# Altium schematic sheet 4.Communication Interface.SchDoc
size A4; Author: ZhangPan; Revision: 2.0; SheetNumber: 4; SheetTotal: 4; Size: A3; Contact: 0731-88731029
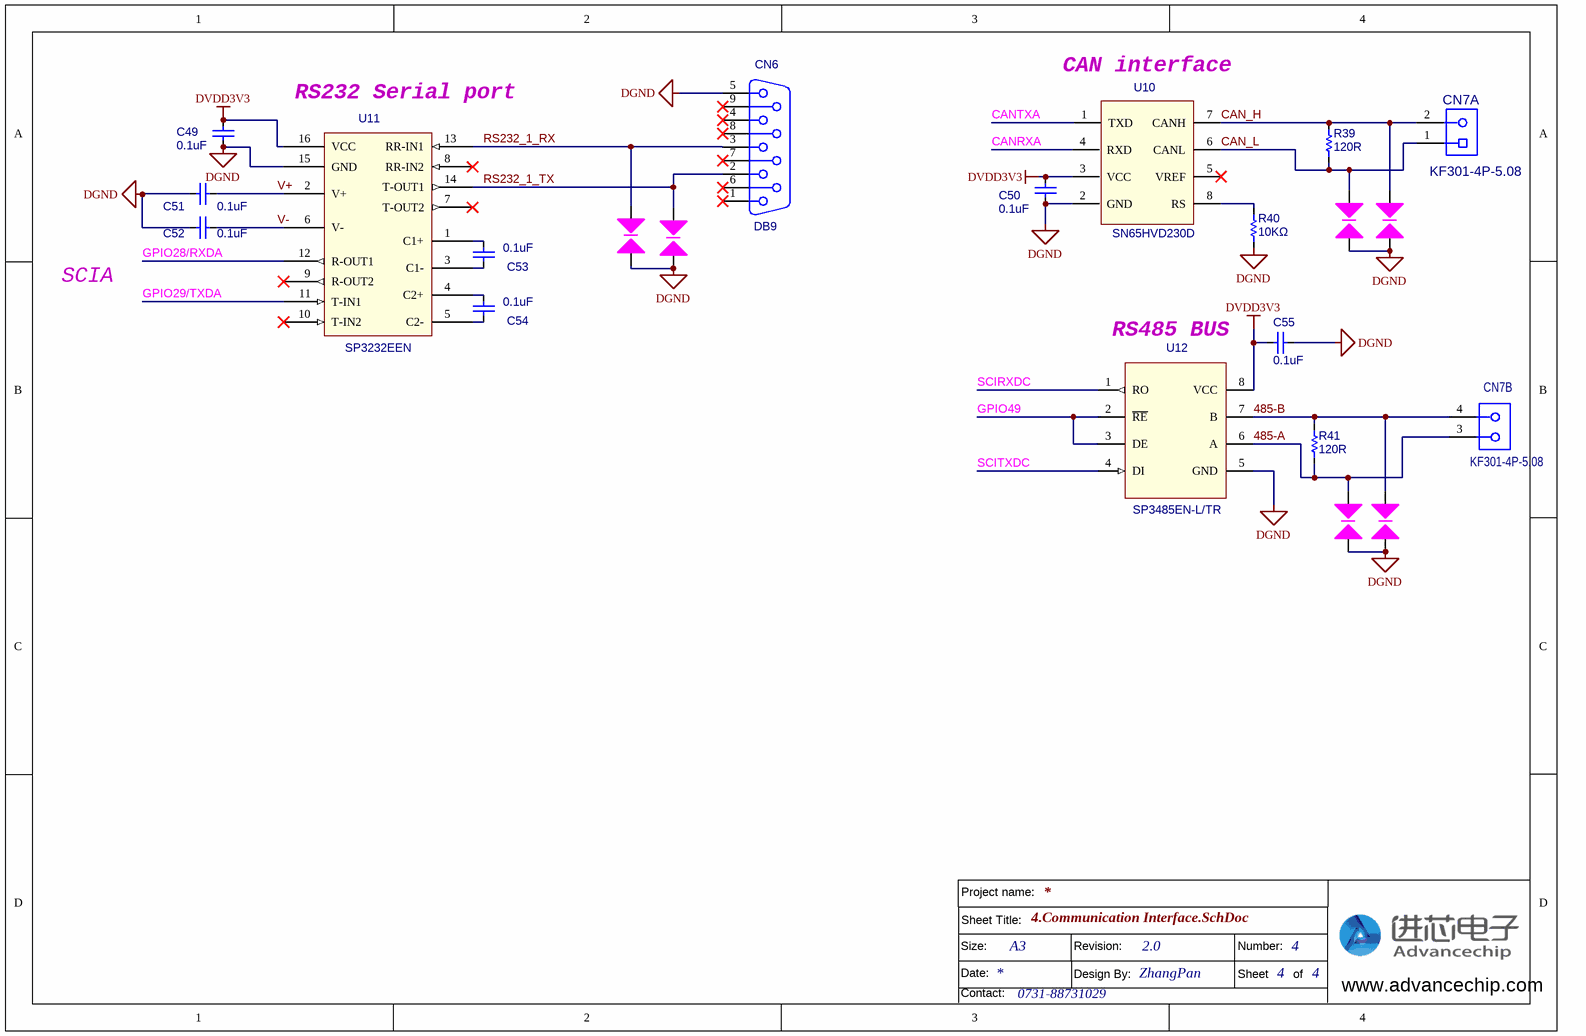
[diagram p0: 4.Communication Interface.SchDoc]

## Parts
C49  value 0.1uF  [C0603]  (hidden comment: 0.1uF/50V)
C50  value 0.1uF  [C0603]  (hidden comment: 0.1uF/50V)
C51  value 0.1uF  [C0603]  (hidden comment: 0.1uF/50V)
C52  value 0.1uF  [C0603]  (hidden comment: 0.1uF/50V)
C53  value 0.1uF  [C0603]  (hidden comment: 0.1uF/50V)
C54  value 0.1uF  [C0603]  (hidden comment: 0.1uF/50V)
C55  value 0.1uF  [C0603 - duplicate]  (hidden comment: 0.1uF/50V)
CN6  DB9  [db9]
CN7  KF301-4P-5.08  [J-DG128-4]  (parts A,B of 2)
R39  120R  [1206RX]
R40  10KΩ  [R0603]
R41  120R  [1206RX]
T1  SPARK_GAP  [SPARK_GAP]  (value not drawn)
T2  SPARK_GAP  [SPARK_GAP]  (value not drawn)
T3  SPARK_GAP  [SPARK_GAP]  (value not drawn)
T4  SPARK_GAP  [SPARK_GAP]  (value not drawn)
T5  SPARK_GAP  [SPARK_GAP]  (value not drawn)
T6  SPARK_GAP  [SPARK_GAP]  (value not drawn)
U10  SN65HVD230D  [SO-8]
U11  SP3232EEN  [SOIC-16_150mil]
U12  SP3485EN-L/TR  [SO-8]

## Nets
DGND: C49.2 C50.2 C51.2 C52.2 C55.2 CN6.5 R40.1 T1.2(A) T2.2(A) T3.2(A) T4.2(A) T5.2(A) T6.2(A) U10.2(GND) U11.15(GND) U12.5(GND)
DVDD3V3: C49.1 C50.1 C55.1 U10.3(VCC) U11.16(VCC) U12.8(VCC)
485-A: CN7.3 R41.1 T5.1(A) U12.6(A)
485-B: CN7.4 R41.2 T6.1(A) U12.7(B)
CAN_H: CN7.2 R39.2 T2.1(A) U10.7(CANH)
CAN_L: CN7.1 R39.1 T1.1(A) U10.6(CANL)
CANRXA: U10.4(RXD)
CANTXA: U10.1(TXD)
GPIO28/RXDA: U11.12(R-OUT1)
GPIO29/TXDA: U11.11(T-IN1)
GPIO49: U12.2(~{RE}) U12.3(DE)
RS232_1_RX: CN6.3 T3.1(A) U11.13(RR-IN1)
RS232_1_TX: CN6.2 T4.1(A) U11.14(T-OUT1)
SCIRXDC: U12.1(RO)
SCITXDC: U12.4(DI)
V+: C51.1 U11.2(V+)
V-: C52.1 U11.6(V-)
NetC53_1: C53.1 U11.1(C1+)
NetC53_2: C53.2 U11.3(C1-)
NetC54_1: C54.1 U11.4(C2+)
NetC54_2: C54.2 U11.5(C2-)
NetR40_2: R40.2 U10.8(RS)

Not connected (* = marked no-connect by the designer): CN6 1* 4* 6* 7* 8* 9*; U10 5(VREF)*; U11 7(T-OUT2)* 8(RR-IN2)* 9(R-OUT2)* 10(T-IN2)*

## Notes on the sheet
- (near U11) RS232 Serial port
- (near U10) CAN interface
- SCIA
- RS485 BUS
- Sheet Title:
- Project name:
- Size:
- Date:
- Contact:
- Revision:
- Design By:
- Number:
- Sheet       of
- www.advancechip.com

## Library data of the parts
C49-C55 = Cap: 贴片电容; Published: 8-Jun-2000; LatestRevisionDate: 17-Jul-2002; LatestRevisionNote: Re-released for DXP Platform.; Publisher: Altium Limited
CN6 = D Connector 9: DB9插座; PackageDocument: O; Positions: 9; Gender: Receptacle; Published: 15-Jun-2001; LatestRevisionDate: 17-Jul-2002; LatestRevisionNote: Re-released for DXP Platform.; DatasheetDocument: 1-Sep-1999; PackageReference: 788750; Publisher: Altium Limited; Orientation: Right Angle
CN7 = CON4: 连接器
R39 = Res: 贴片电阻; Published: 8-Jun-2000; LatestRevisionDate: 17-Jul-2002; LatestRevisionNote: Re-released for DXP Platform.; Publisher: Altium Limited
R40 R41 = Res: 贴片电阻; Value: 1K; Published: 8-Jun-2000; LatestRevisionDate: 17-Jul-2002; LatestRevisionNote: Re-released for DXP Platform.; Publisher: Altium Limited
T1-T6 = GND SIDE: 静电GAP
U10 = SN65HVD230D: 3.3V CAN通讯
U11 = MAX232: 低压232通讯芯片
U12 = SP3485E: 3.3V 485总线收发器